# Altium schematic sheet RS_485.SchDoc
size 381 x 241 mm; SheetNumber: 3; SheetTotal: 5
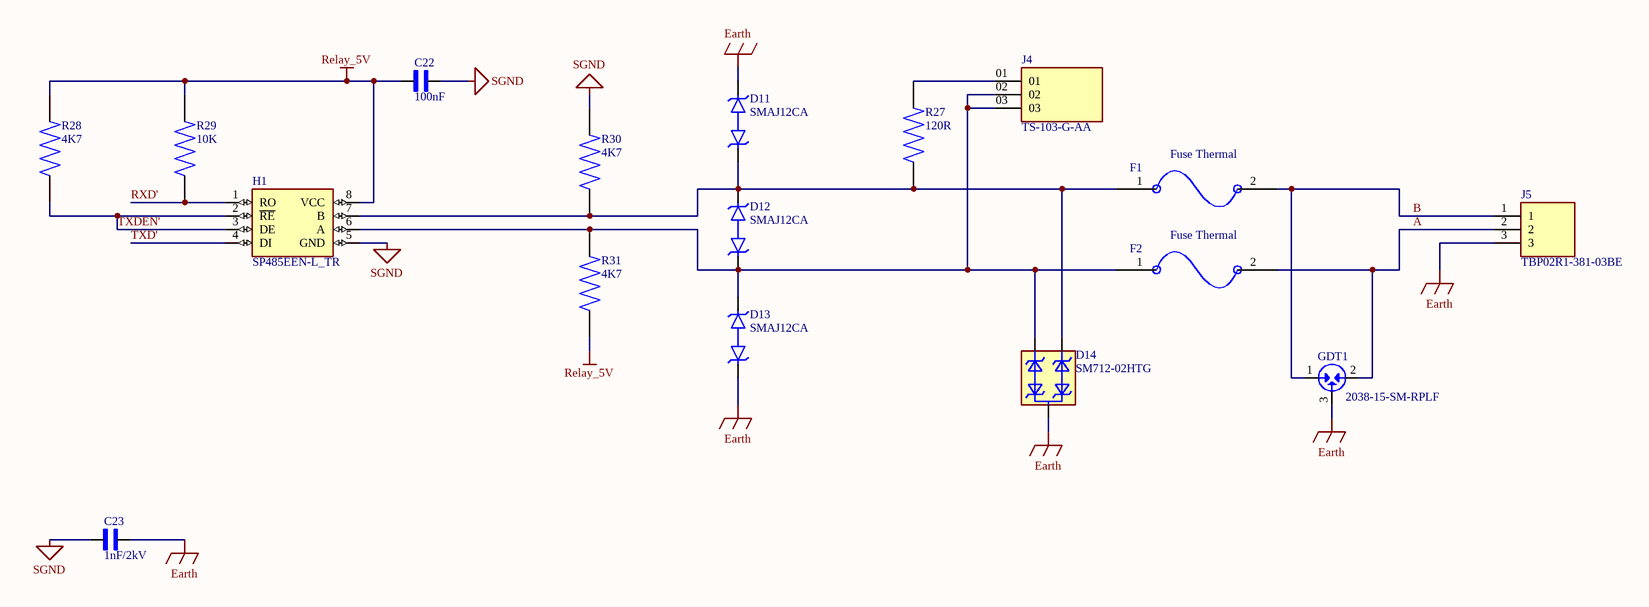
[diagram p0: RS_485.SchDoc]

## Parts
C22  100nF  [CAPC1608X94N]
C23  1nF/2kV  [CAPC4532X155N]
D11  SMAJ12CA  [DIOM5026X229N]
D12  SMAJ12CA  [DIOM5026X229N]
D13  SMAJ12CA  [DIOM5026X229N]
D14  SM712-02HTG  [SOT23]
F1  Fuse Thermal  [RESC3115X65N]
F2  Fuse Thermal  [RESC3115X65N]
GDT1  2038-15-SM-RPLF  [TVS_2031-42T-SM-RPLF]
H1  SP485EEN-L_TR  [SOIC127P600X175-8N]
J4  TS-103-G-AA  [SAMTEC_TS-103-G-AA]
J5  TBP02R1-381-03BE  [CUI_TBP02R1-381-03BE]
R27  120R  [RES_ERJU03J474V]
R28  4K7  [RES_ERJU03J474V]
R29  10K  [RES_ERJU03J474V]
R30  4K7  [RES_ERJU03J474V]
R31  4K7  [RES_ERJU03J474V]

## Nets
Earth: C23.2 D11.2(A) D13.1(K) D14.3 GDT1.3 J5.3
Relay_5V: C22.2 H1.8(VCC) R28.2 R29.2 R31.1
SGND: C22.1 C23.1 H1.5(GND) R30.2
A: F2.2 GDT1.2 J5.2
B: F1.2 GDT1.1 J5.1
RXD': H1.1(RO) R29.1
TXD': H1.4(DI)
TXDEN': H1.2(~{RE}) H1.3(DE) R28.1
NetD11_1: D11.1(K) D12.2(A) D14.1 F1.1 H1.7(B) R27.2 R30.1
NetD12_1: D12.1(K) D13.2(A) D14.2 F2.1 H1.6(A) J4.02 J4.03 R31.2
NetJ4_01: J4.01 R27.1

## Library data of the parts
C22 = cap_0603_VJ0603D3R9DXCAP: cap 0603 (1608 Metric); MF: Vishay Vitramon; SnapEDA_Link: https://www.snapeda.com/parts/VJ0603D3R9DXCAP/Vishay/view-part/?ref=snap; Package: 1608 Vishay Vitramon; Value: *; MP: VJ0603D3R9DXCAP; Check_prices: https://www.snapeda.com/parts/VJ0603D3R9DXCAP/Vishay/view-part/?ref=eda
C23 = C1812C102KGRACAUTO: 1000 pF Â±10% 2000V (2kV) Ceramic Capacitor X7R 1812 (4532 Metric); MF: KEMET; SnapEDA_Link: https://www.snapeda.com/parts/C1812C102KGRACAUTO/KEMET/view-part/?ref=snap; Package: 4532 KEMET; Value: *; MP: C1812C102KGRACAUTO; Check_prices: https://www.snapeda.com/parts/C1812C102KGRACAUTO/KEMET/view-part/?ref=eda
D11-D13 = SMAJ12CA: 19.9V Clamp 20.1A Ipp Tvs Diode Surface Mount SMAJ (DO-214AC); MF: AVX; SnapEDA_Link: https://www.snapeda.com/parts/SMAJ12CA/AVX/view-part/?ref=snap; Package: DO-214 AVX; Value: *; MP: SMAJ12CA; Check_prices: https://www.snapeda.com/parts/SMAJ12CA/AVX/view-part/?ref=eda
D14 = SM712-02HTG: TVS Diode, SM712 Series, 31V Clamp, 600W Peak Pulse, Surface Mount, SOT23-3 | Littelfuse SM712-02HTG; MF: Littelfuse Inc.; SnapEDA_Link: https://www.snapeda.com/parts/SM712-02HTG/Littelfuse/view-part/?ref=snap; Package: SOT-23 Littelfuse Inc.; Value: *; MP: SM712-02HTG; Check_prices: https://www.snapeda.com/parts/SM712-02HTG/Littelfuse/view-part/?ref=eda
F1 F2 = Fuse Thermal: Fuse, Resettable, Fast Acting, 10A, Sz 1206, 0.134x0.071x0.033", SMT, 24VDC, PCB | Bourns MF-NSMF200-2
GDT1 = 2038-15-SM-RPLF: Gas Tube, 3 Electr, 150V, 10kA, 5 mm, SMT, Reel pack, 2038 Series | Bourns 2038-15-SM-RPLF; MP: 2031-42T-SM-RPLF; SnapEDA_Link: https://www.snapeda.com/parts/2031-42T-SM-RPLF/Bourns/view-part/?ref=snap; Package: None; Value: *; MF: Bourns; Check_prices: https://www.snapeda.com/parts/2031-42T-SM-RPLF/Bourns/view-part/?ref=eda
H1 = SP485EEN-L_TR: SP485E Series 10Mbps 5V Enhanced Low EMI Half Duplex RS-485 Transceiver -NSOIC-8; MF: MaxLinear, Inc.; MP: SP485EEN-L/TR; SnapEDA_Link: https://www.snapeda.com/parts/SP485EEN-L/TR/MaxLinear/view-part/?ref=snap; Package: SOIC-8 Exar; Value: *; Check_prices: https://www.snapeda.com/parts/SP485EEN-L/TR/MaxLinear/view-part/?ref=eda
J4 = TS-103-G-AA: Conn Unshrouded Header HDR 3 POS 2.54mm Solder ST Thru-Hole Bulk; MF: Samtec; MP: TS-103-G-AA; Price: None; Purchase-URL: https://pricing.snapeda.com/search/part/TS-103-G-AA/?ref=eda; Package: None; Check_prices: https://www.snapeda.com/parts/TS-103-G-AA/Samtec/view-part/?ref=eda; Value: *; Availability: In Stock; SnapEDA_Link: https://www.snapeda.com/parts/TS-103-G-AA/Samtec/view-part/?ref=snap
J5 = TBP02R1-381-03BE: 2~24 Poles, Pluggable,Receptacle, Horizontal, 3.81 Pitch, Terminal Block Connector; MF: Same Sky; SnapEDA_Link: https://www.snapeda.com/parts/TBP02R1-381-03BE/Same+Sky/view-part/?ref=snap; Package: None; Value: *; MP: TBP02R1-381-03BE; Check_prices: https://www.snapeda.com/parts/TBP02R1-381-03BE/Same+Sky/view-part/?ref=eda
R27-R31 = res_0603_ERJU03J474V: 0603 Anti-Sulfurated; MF: Panasonic; SnapEDA_Link: https://www.snapeda.com/parts/ERJU03J474V/Panasonic/view-part/?ref=snap; Package: 1608-2 Panasonic; Value: *; MP: ERJU03J474V; Check_prices: https://www.snapeda.com/parts/ERJU03J474V/Panasonic/view-part/?ref=eda